# EAGLE design rs232_and ch340  (EAGLE 9.6.2)
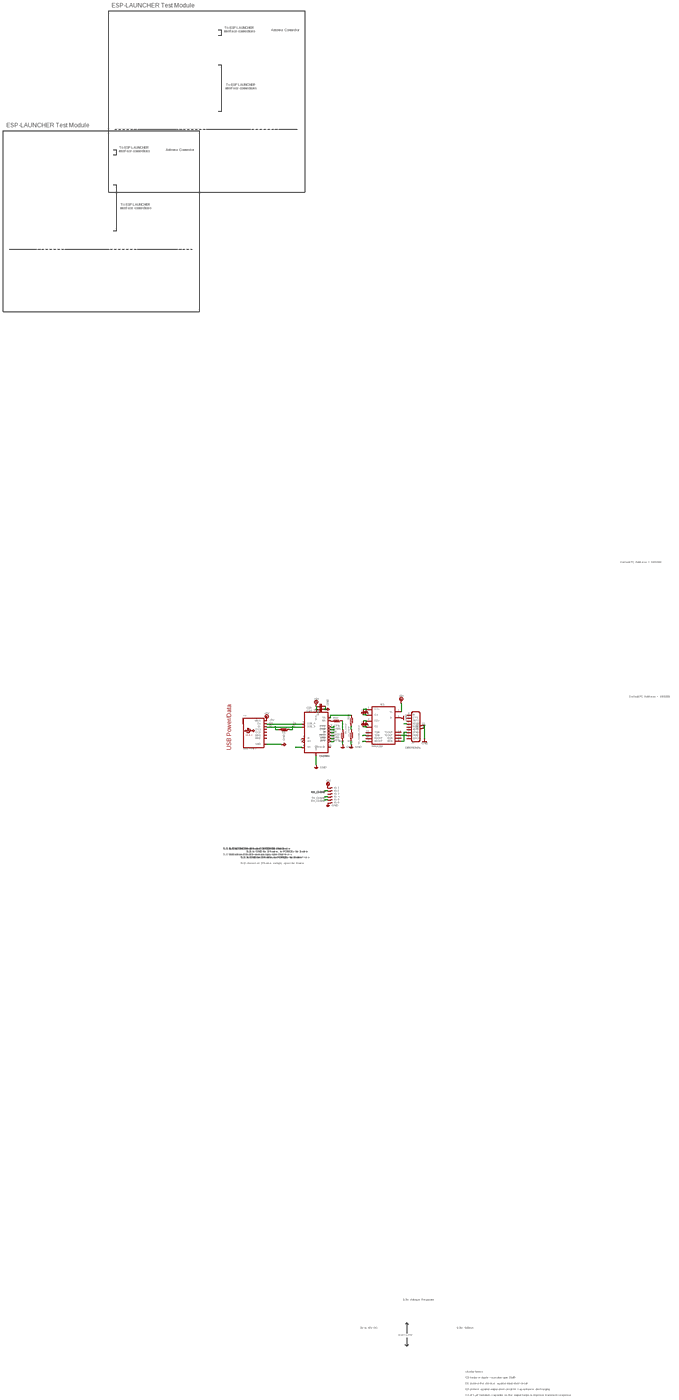
[diagram p0: schematic, sheet 1, overview]
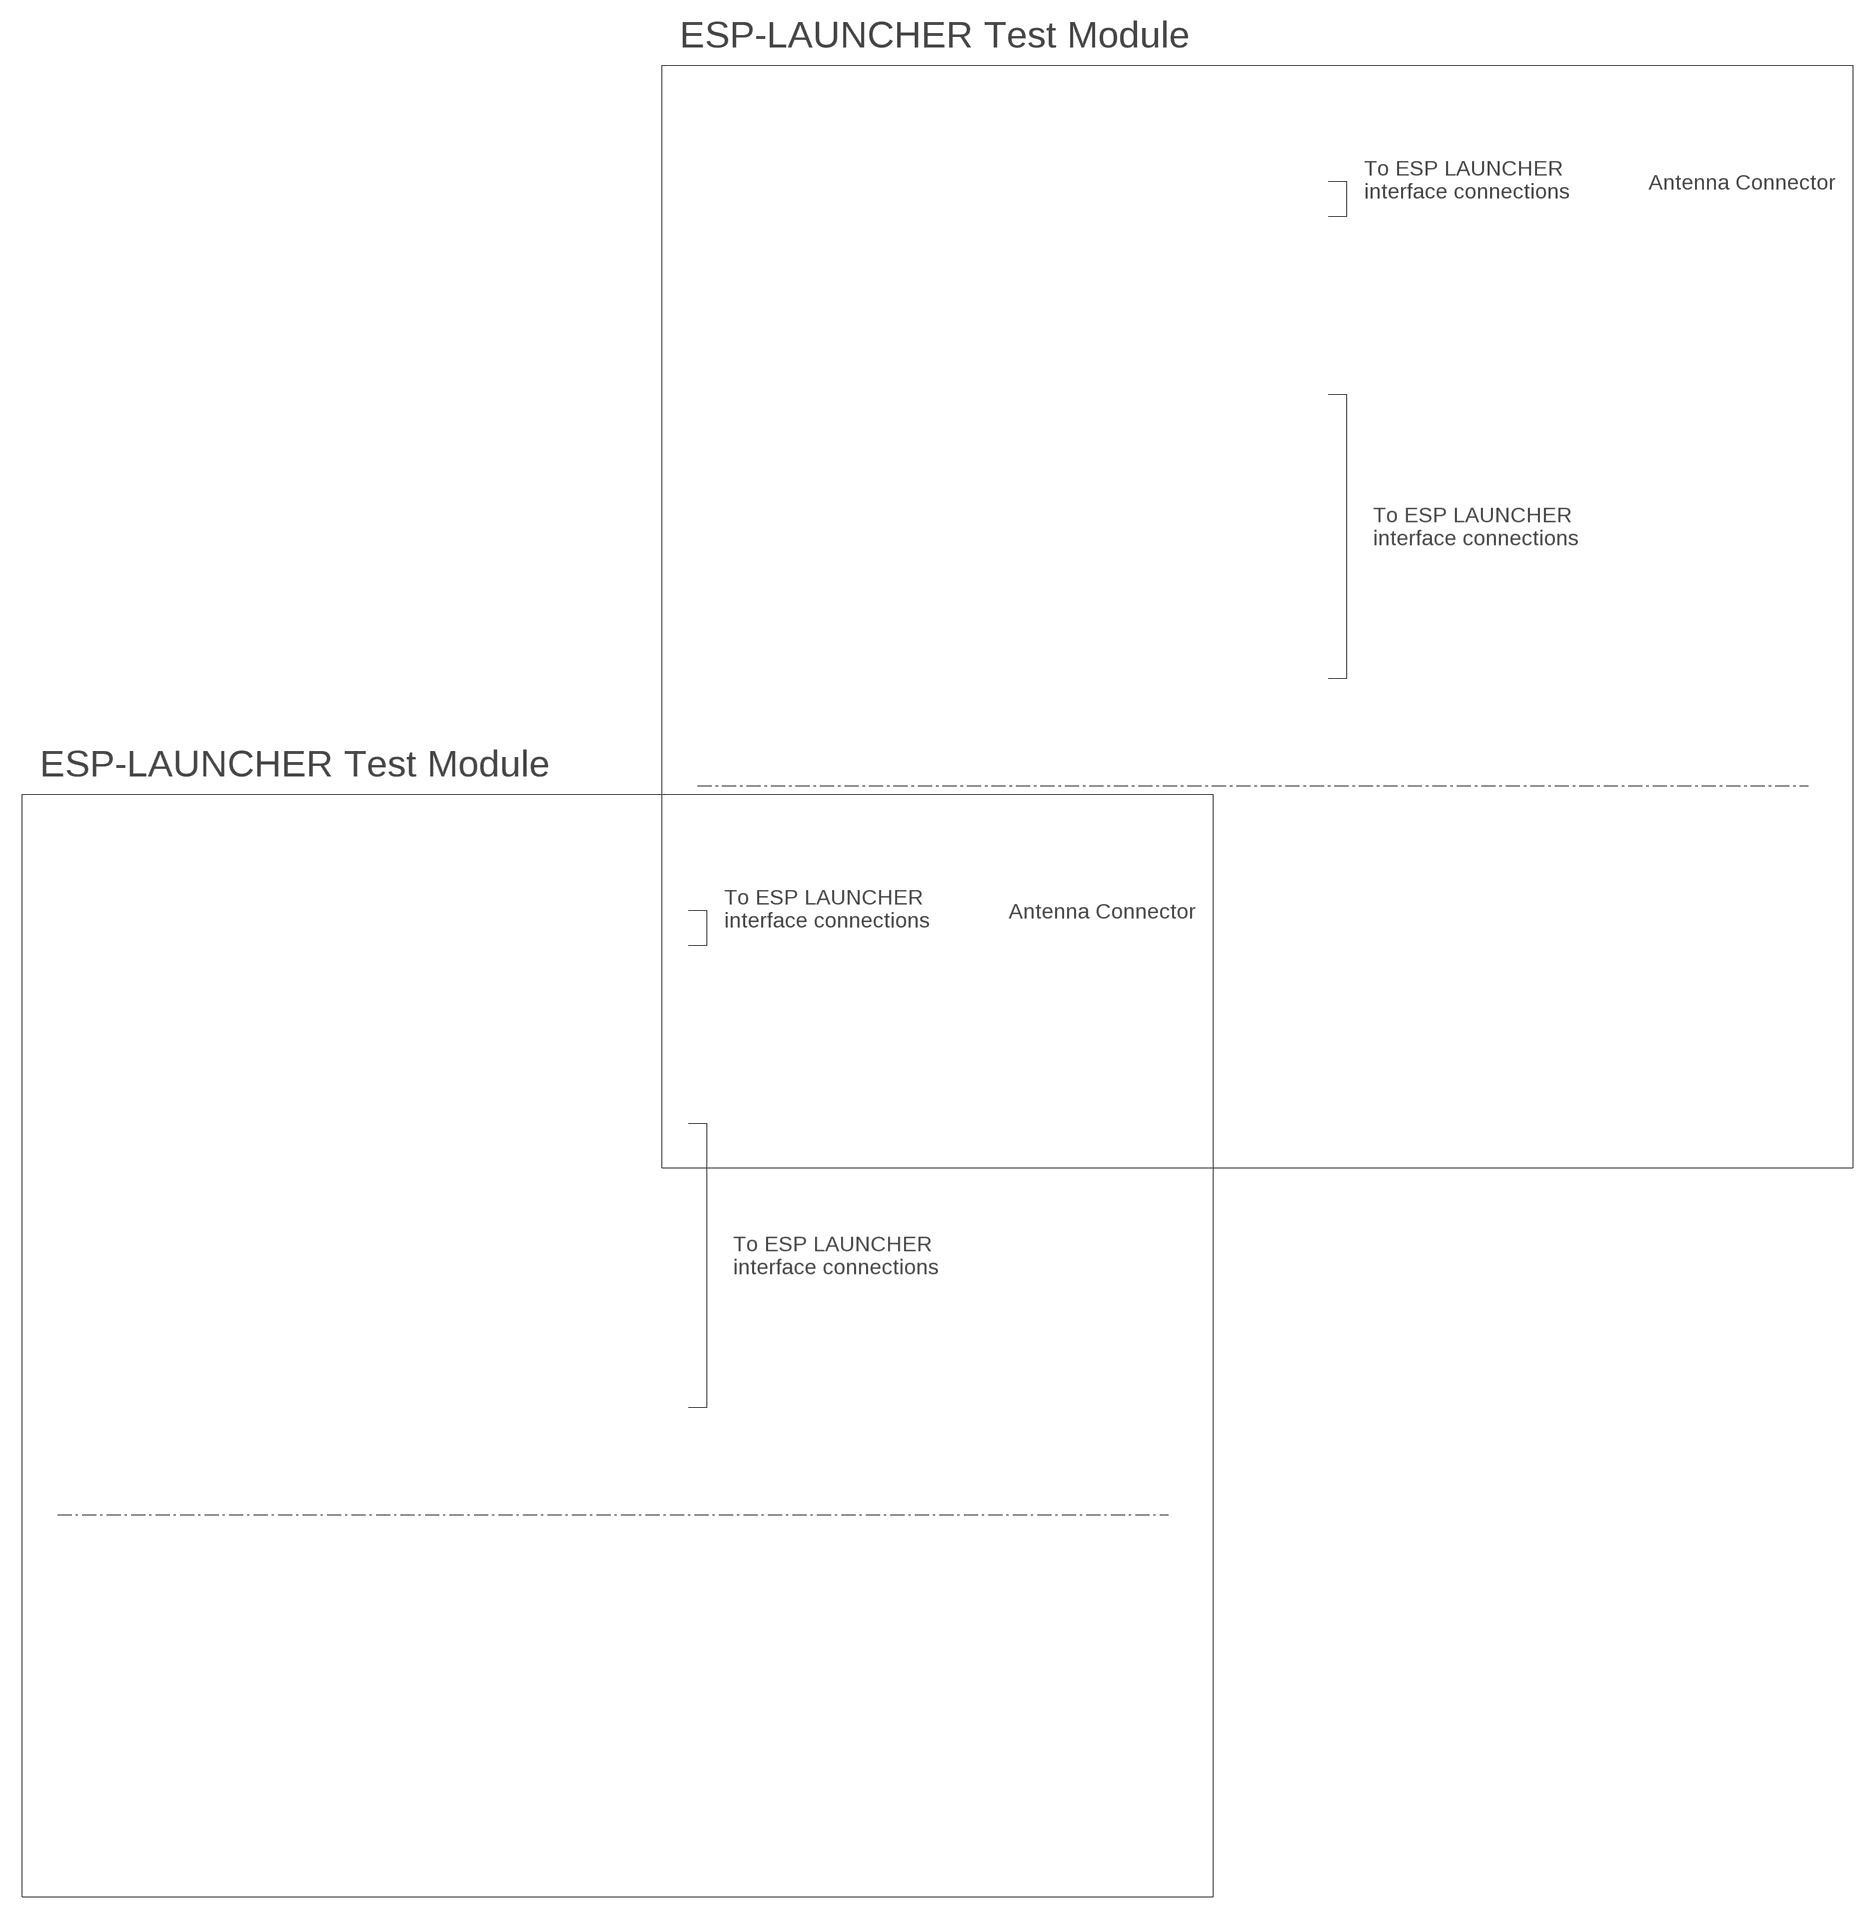
[diagram p1: schematic, sheet 1, part 1 of 4]
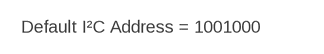
[diagram p2: schematic, sheet 1, part 2 of 4]
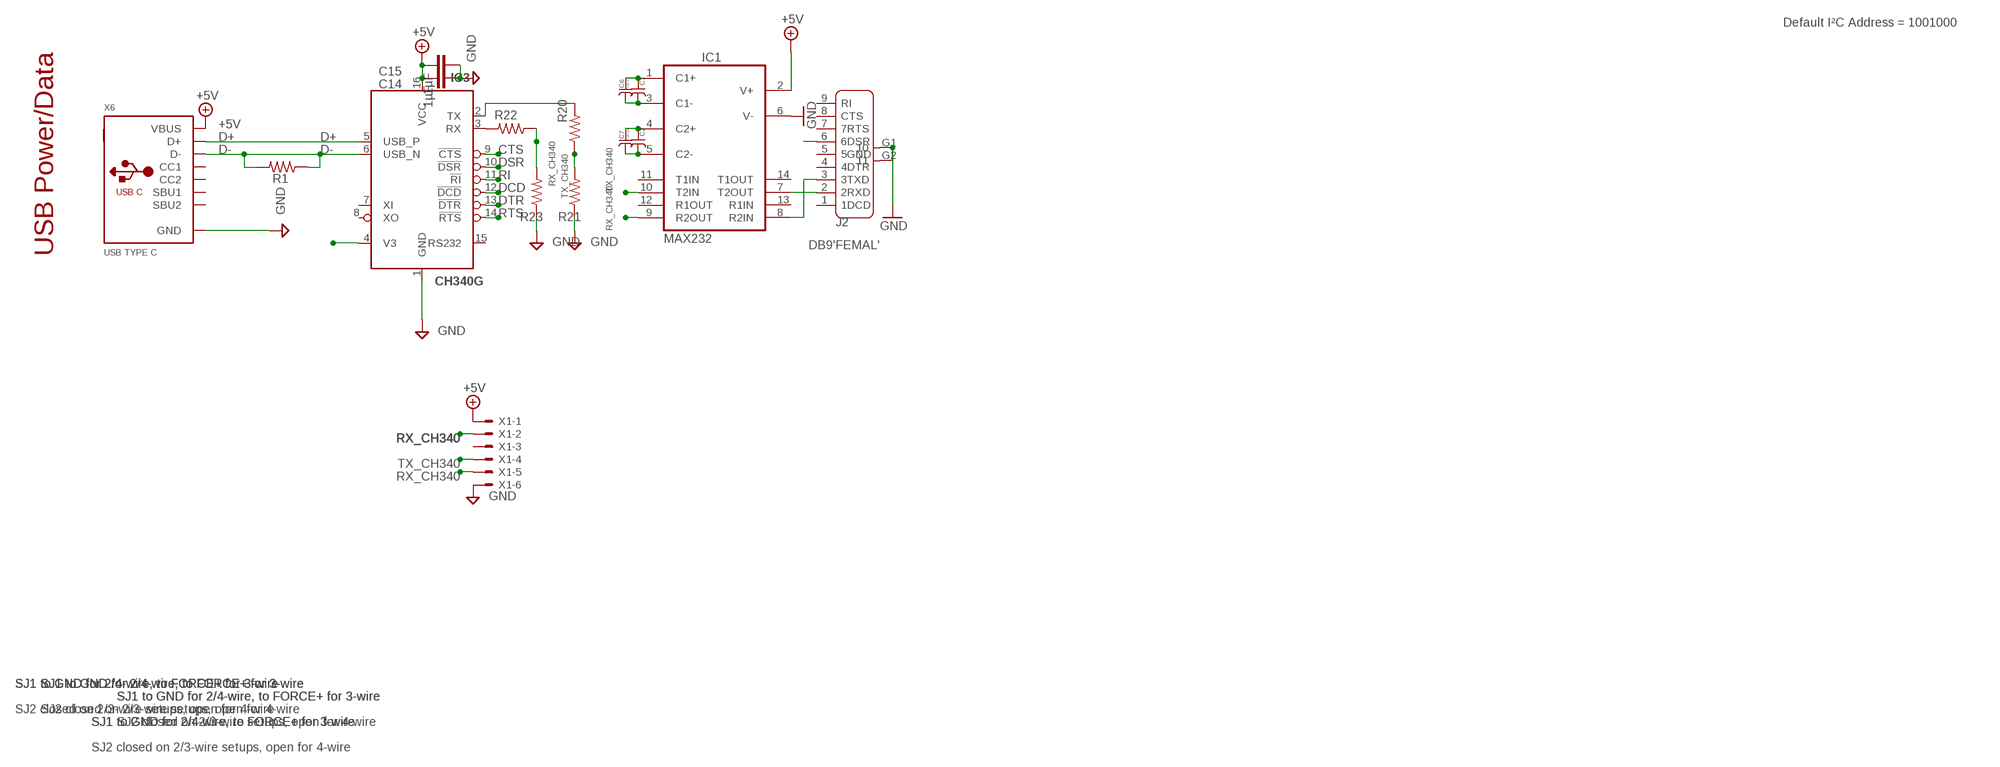
[diagram p3: schematic, sheet 1, part 3 of 4]
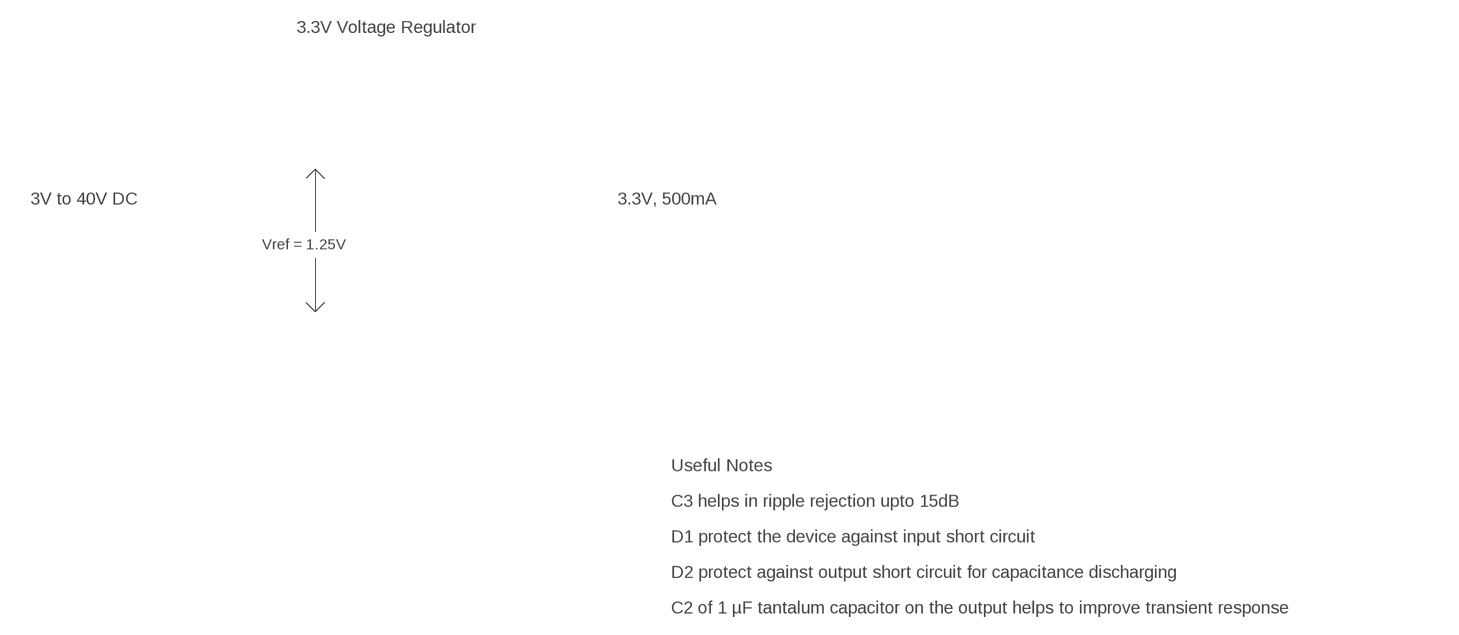
[diagram p4: schematic, sheet 1, part 4 of 4]

## Parts
C1  CAP_TANTA  [TANT_1206]
C2  CAP_TANTA  [TANT_1206]
C6  CAP_ELE  [C_8MM]
C7  CAP_ELE  [C_8MM]
C14  1µF  C-EUC0805K  [C0805K]
C15  1µF  C-EUC0805K  [C0805K]
IC1  MAX232  [DIL16]
IC3  CH340G  [SOIC16N]
J2  DB9'FEMAL'  [DB9]
R1  R-US_M1206  [M1206]
R20  R-US_M1206  [M1206]
R21  R-US_M1206  [M1206]
R22  R-US_M1206  [M1206]
R23  R-US_M1206  [M1206]
X1  22-23-2061  [22-23-2061]
X6  USB TYPE C  USB_C  [USB_C_CUSB31-CFM2AX-01-X]

## Nets
+5V: C14.2 C15.2 IC1.2(V+) IC3.16(VCC) X1.1 X6.A4B9(VBUS) X6.B4A9(VBUS)
CTS: IC3.9(!CTS)
D+: IC3.5(USB_P) X6.A6(D+) X6.B6(D+)
D-: IC3.6(USB_N) R1.1 R1.2 X6.A7(D-) X6.B7(D-)
DCD: IC3.12(!DCD)
DSR: IC3.10(!DSR)
DTR: IC3.13(!DTR)
GND: C14.1 C15.1 IC1.6(V-) IC3.1(GND) J2.G1 J2.G2 R21.1 R23.1 X1.6 X6.A1B12(GND) X6.B1A12(GND)
N$1: IC3.2(TX) R20.2
N$2: IC3.4(V3)
N$4: C1.+ C6.1(+) IC1.1(C1+)
N$5: C1.- C6.2(-) IC1.3(C1-)
N$7: C2.+ C7.1(+) IC1.4(C2+)
N$8: C2.- C7.2(-) IC1.5(C2-)
N$9: IC1.7(T2OUT) J2.2(2RXD)
N$13: IC1.8(R2IN) J2.3(3TXD)
N$23: J2.6(6DSR)
N$28: IC3.3(RX) R22.2
RI: IC3.11(!RI)
RTS: IC3.14(!RTS)
RX_CH340: IC1.9(R2OUT) R22.1 R23.2 X1.2 X1.5
TX_CH340: IC1.10(T2IN) R20.1 R21.2 X1.4
Unconnected: IC1.11(T1IN) IC1.12(R1OUT) IC1.13(R1IN) IC1.14(T1OUT) IC3.7(XI) IC3.8(XO) IC3.15(RS232) J2.1(1DCD) J2.4(4DTR) J2.5(5GND) J2.7(7RTS) J2.8(CTS) J2.9(RI) X1.3 X6.A5(CC1) X6.A8(SBU1) X6.B5(CC2) X6.B8(SBU2)

## Notes on the sheet
- ESP-LAUNCHER Test Module
- Antenna Connector
- To ESP LAUNCHER
  interface connections
- To ESP LAUNCHER
  interface connections
- ESP-LAUNCHER Test Module
- Antenna Connector
- To ESP LAUNCHER
  interface connections
- To ESP LAUNCHER
  interface connections
- Default I²C Address = 1001000
- Default I²C Address = 1001000
- USB Power/Data
- SJ1 to GND for 2/4-wire, to FORCE+ for 3-wire | SJ1 to GND for 2/4-wire, to FORCE+ for 3-wire | SJ1 to GND for 2/4-wire, to FORCE+ for 3-wire | SJ1 to GND for 2/4-wire, to FORCE+ for 3-wire
- SJ1 to GND for 2/4-wire, to FORCE+ for 3-wire | SJ1 to GND for 2/4-wire, to FORCE+ for 3-wire
- SJ2 closed on 2/3-wire setups, open for 4-wire | SJ2 closed on 2/3-wire setups, open for 4-wire
- SJ1 to GND for 2/4-wire, to FORCE+ for 3-wire | SJ1 to GND for 2/4-wire, to FORCE+ for 3-wire | SJ2 closed on 2/3-wire setups, open for 4-wire
- SJ2 closed on 2/3-wire setups, open for 4-wire
- 3.3V Voltage Regulator
- 3V to 40V DC | 3.3V, 500mA
- Vref = 1.25V
- Useful Notes
- C3 helps in ripple rejection upto 15dB
- D1 protect the device against input short circuit
- D2 protect against output short circuit for capacitance discharging
- C2 of 1 µF tantalum capacitor on the output helps to improve transient response

## Power pins joined to a net without a drawn wire
GND: IC1.15(GND)
VCC: IC1.16(VCC)

## Library data of the parts
C1 C2 = Squadron:CAP_TANT
C6 C7 = Squadron:CAP_ELE
C14 C15 = rcl:C-EU: CAPACITOR, European symbol; SPICEPREFIX: C
IC1 = maxim:MAX232: RS232 TRANSCEIVER; MF: MAXIM; MPN: MAX232ACPE+; OC_FARNELL: 9723773; OC_NEWARK: 68K4544
IC3 = CH340:CH340G
J2 = DB9:DB9: Check availability <https://pricing.snapeda.com/parts/DB-9/Amphenol/view-part?ref=eda>; AVAILABILITY: In Stock; CHECK_PRICES: https://www.snapeda.com/parts/DB-9/Amphenol/view-part/?ref=eda; DESCRIPTION: Cable Grip 0.38 ~ 0.50 (9.5mm ~ 12.7mm) Aluminum - Silver; MF: Amphenol; MP: DB-9; PACKAGE: None; PRICE: None; SNAPEDA_LINK: https://www.snapeda.com/parts/DB-9/Amphenol/view-part/?ref=snap
R1 R20-R23 = rcl:R-US_: RESISTOR, American symbol; SPICEPREFIX: R
X1 = 1.27mm connector:22-23-2061: .100" (2.54mm) Center Header - 6 Pin; MF: MOLEX; MPN: 22-23-2061; OC_FARNELL: 1462922; OC_NEWARK: 27C1933
X6 = adafruit_electromech:USB_C: USB Type-C USB 2.0 Connector

## Module WAVESHAREDISPLAY
Ports: 

### Library data of the parts

## Net classes
1 power: width 0.254 mm

## Board
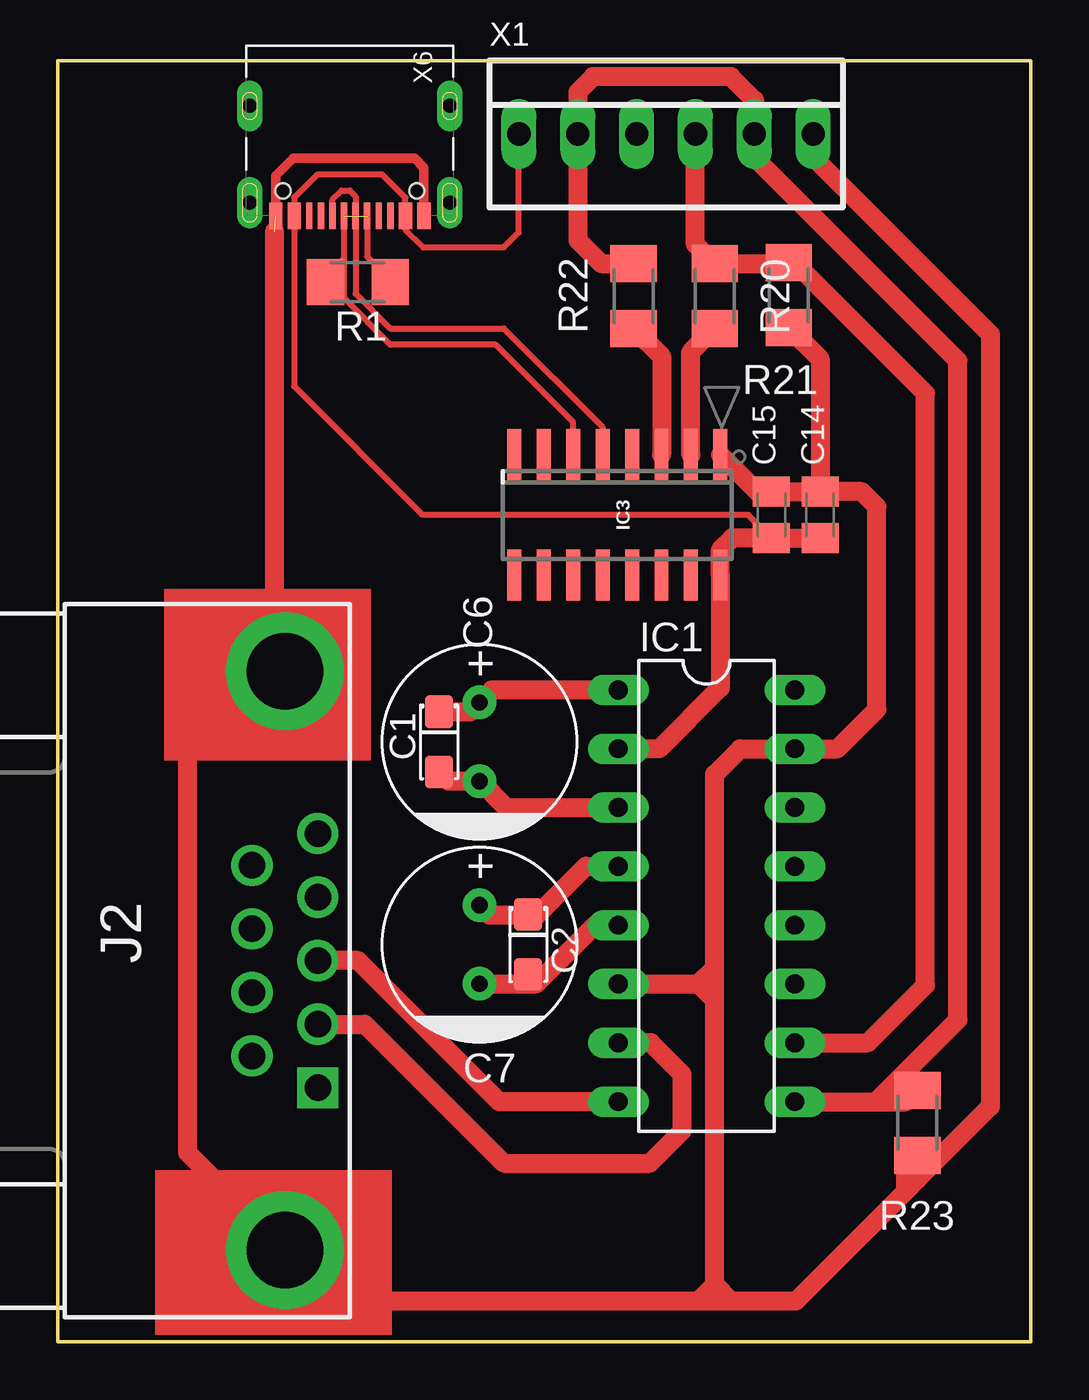
[diagram p5: board, top side]

Size 42 x 55.32 mm. Coordinates in mm from the lower left corner, seen from the top.
Outline: 0,0 42,0 42,55.32 0,55.32 0,0
Copper layers (1*16): Top 0.035mm / dielectric 1.5mm / Bottom 0.035mm
Design rules "default": minimum track width 6mil, minimum drill 0.35mm, track to track 6mil, track to pad 6mil, pad to pad 6mil, via to via 6mil, smd to smd 6mil, copper to edge 40mil, drill to drill 6mil, minimum pad ring 10mil, minimum via ring 8mil, stop-mask expansion 4mil, vias tented up to drill 0mil, thermal gap 10mil

### Footprints (pad centres in the part's own frame; a part is rotated, then mirrored left to right if it is on the bottom)
TANT_1206 = smd 1.4 x 1.2: + -1.3,0; - 1.3,0
C_8MM = drill 0.7 pad 1.45: 1 -1.7,0; 2 1.7,0
C0805K = smd 1.3 x 1.6: 1 -1,0; 2 1,0
DIL16 = drill 0.813 long: 1 -8.89,-3.81; 2 -6.35,-3.81; 3 -3.81,-3.81; 4 -1.27,-3.81; 5 1.27,-3.81; 6 3.81,-3.81; 7 6.35,-3.81; 8 8.89,-3.81; 9 8.89,3.81; 10 6.35,3.81; 11 3.81,3.81; 12 1.27,3.81; 13 -1.27,3.81; 14 -3.81,3.81; 15 -6.35,3.81; 16 -8.89,3.81
SOIC16N = smd 2.2 x 0.6: 1 -2.6,4.445; 2 -2.6,3.175; 3 -2.6,1.905; 4 -2.6,0.635; 5 -2.6,-0.635; 6 -2.6,-1.905; 7 -2.6,-3.175; 8 -2.6,-4.445; 9 2.6,-4.445; 10 2.6,-3.175; 11 2.6,-1.905; 12 2.6,-0.635; 13 2.6,0.635; 14 2.6,1.905; 15 2.6,3.175; 16 2.6,4.445
DB9 = drill 1.143 pad 1.778 square: 1 5.486,1.422 | drill 1.143 pad 1.778: 2 2.743,1.422; 3 0,1.422; 4 -2.743,1.422; 5 -5.486,1.422; 6 4.115,-1.422; 7 1.372,-1.422; 8 -1.372,-1.422; 9 -4.115,-1.422 | drill 3.302 pad 5.08: G1 12.497,0; G2 -12.497,0
M1206 = smd 1.6 x 2: 1 -1.4,0; 2 1.4,0
22-23-2061 = drill 1 long: 1 -6.35,0; 2 -3.81,0; 3 -1.27,0; 4 1.27,0; 5 3.81,0; 6 6.35,0
USB_C_CUSB31-CFM2AX-01-X = smd 0.575 x 1.15: A1B12 -3.2,3.545; A4B9 -2.4,3.545; B1A12 3.2,3.545; B4A9 2.4,3.545 | smd 0.275 x 1.15: A5 -1.25,3.545; A6 -0.25,3.545; A7 0.25,3.545; A8 1.25,3.545; B5 1.75,3.545; B6 0.75,3.545; B7 -0.75,3.545; B8 -1.75,3.545 | drill 0.6 pad 1 long: M1 -4.32,2.97; M2 4.32,2.97; M3 -4.32,-1.21; M4 4.32,-1.21 | hole 0.65: 2.89,2.47; -2.89,2.47

### Placement (x,y rotation side)
C1  16.45,25.9 270 top
C2  20.3,17.15 270 top
C6  18.2,25.9 270 top
C7  18.2,17.15 270 top
C14  32.9,35.7 270 top
C15  30.8,35.7 270 top
IC1  28,19.25 270 top
IC3  24.15,35.7 270 top
J2  9.8,16.45 270 top
R1  12.95,45.75 180 top
R20  28.35,45.15 270 top
R21  31.55,45.19 90 top
R22  24.85,45.15 270 top
R23  37.1,9.45 90 top
X1  26.25,52.15 0 top
X6  12.6,52.15 180 top

### Tracks (layer width: path | path; a pad name or v marks a point on that pad's centre or on a via)
+5V
  Top 0.254: X1.1 19.9,47.9 19.25,47.25 15.75,47.25 15,48 X6.A4B9 15,49.4 14,50.4 11.2,50.4 10.2,49.4 X6.B4A9 10.2,41.25 15.75,35.7 29.8,35.7 C15.2
  Top 0.813: C14.2 C15.2 29.1,34.7 28.59,34.2 IC3.16 28.59,28.25 25.95,25.6 IC1.2
D+
  Top 0.254: X6.B6 11.85,49.3 12.25,49.7 12.6,49.7 12.85,49.45 X6.A6 12.85,45.25 14.35,43.75 19.25,43.75 23.52,39.48 IC3.5
D-  (1 unrouted)
  Top 0.254: IC3.6 22.25,39.7 18.9,43.05 14.35,43.05 12.35,45.05 X6.A7 12.35,46.77 12.02,46.44 11.55,46.44 R1.2 | X6.B7 13.35,46.85 14.35,45.85 R1.1
GND  (1 unrouted)
  Top 0.406: X6.B1A12 9.4,50.35 10.15,51.1 15.4,51.1 15.8,50.7 X6.A1B12
  Top 0.813: IC3.1 30.2,36.7 C15.1 C14.1 | C14.1 34.7,36.7 35.35,36.05 35.35,27.3 33.65,25.6 IC1.15 29.45,25.6 28.35,24.5 28.35,16.14 | R21.1 32.9,42.44 C14.1 | 27.65,1.75 28.35,2.45 | 27.65,1.75 12,1.75 J2.G1 5.6,8.15 5.6,25.9 9.1,29.4 10.85,29.4 10.4,28.95 J2.G2 9.35,29.39 9.35,47.93 | X1.6 32.6,51.15 40.25,43.5 40.25,10.15 37.1,7 | 37.1,7 36.58,6.47 | 36.58,6.47 31.85,1.75 29.05,1.75 | 29.05,1.75 27.65,1.75 | 28.35,2.45 29.05,1.75 | 28.35,2.45 28.35,14.74 | 28.35,14.74 28.35,15.75 | 28.35,15.75 28.35,16.14 | IC1.6 27.65,15.44 | 27.65,15.44 28.04,15.44 28.35,15.75 | 27.65,15.44 28.35,14.74 | 27.65,15.44 28.35,16.14 | 37.1,7 R23.1 36.58,7.53 36.58,6.47
N$1
  Top 0.813: R20.2 27.3,42.7 27.3,38.33 IC3.2
N$4
  Top 0.813: IC1.1 18.74,28.14 C6.1 17.8,27.2 C1.+
N$5
  Top 0.813: IC1.3 19.34,23.06 C6.2 16.85,24.2 C1.-
N$7
  Top 0.813: C7.1 18.63,18.42 20.3,18.42 | 20.3,18.42 20.69,18.42 22.79,20.52 IC1.4 | C2.+ 20.3,18.42
N$8
  Top 0.813: C7.2 20.3,15.45 | 20.3,15.45 20.65,15.45 23.18,17.98 IC1.5 | C2.- 20.3,15.45
N$9
  Top 0.813: J2.2 13.24,13.71 19.25,7.7 25.55,7.7 26.95,9.1 26.95,11.55 25.6,12.9 IC1.7
N$13
  Top 0.813: IC1.8 19.04,10.36 12.95,16.45 J2.3
N$28
  Top 0.813: R22.2 26.05,42.55 IC3.3
RX_CH340
  Top 0.813: R23.2 36.61,10.36 IC1.9 35.31,10.36 38.85,13.9 38.85,42.35 30.06,51.14 X1.5 30.06,53.61 29.05,54.62 23.1,54.62 22.44,53.96 X1.2 22.44,47.56 23.45,46.55 R22.1
TX_CH340
  Top 0.813: IC1.10 34.96,12.9 37.45,15.39 37.45,40.95 32.38,46.02 | R21.2 31.59,46.55 R20.1 27.52,47.38 X1.4
(copper drawn outside any net)
  shapes: Top area x2